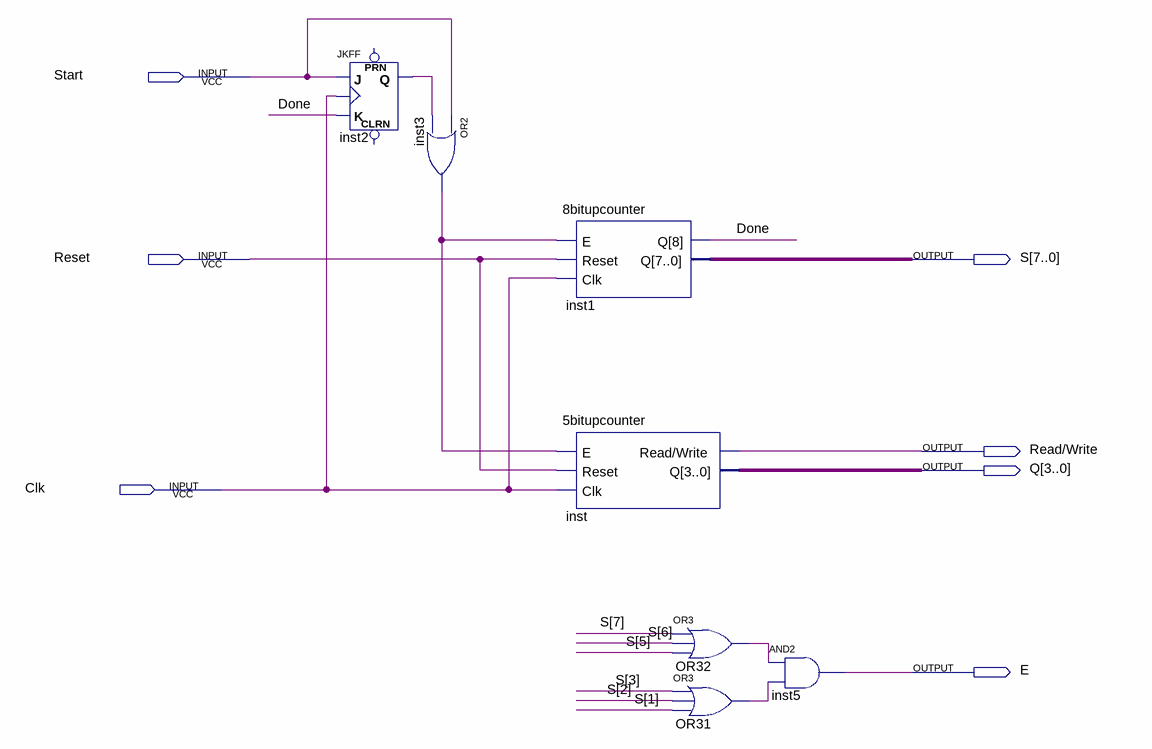
[diagram p0: schematic sheet]
// Quartus schematic Control.bdf as structural Verilog: 7 symbols, 7 pins
module Control (
  input  Start,
  input  Reset,
  input  Clk,
  output [7:0] S,
  output \Read/Write ,
  output [3:0] Q,
  output E
);

  wire Done, inst2_q, inst3_out, OR31_out, OR32_out;

  JKFF inst2 (.K(Done), .J(Start), .CLK(Clk), .Q(inst2_q));  // open: PRN, CLRN
  or inst3 (inst3_out, Start, inst2_q);
  \8bitupcounter  inst1 (.E(inst3_out), .Reset(Reset), .Clk(Clk), .Q({Done, S}));
  \5bitupcounter  inst (.E(inst3_out), .Reset(Reset), .Clk(Clk), .\Read/Write (\Read/Write ), .Q(Q));
  or OR32 (OR32_out, S[7], S[6], S[5]);
  or OR31 (OR31_out, S[3], S[2], S[1]);
  and inst5 (E, OR32_out, OR31_out);
endmodule
